# Altium schematic sheet Teclado_V2.SchDoc
size A2; SheetNumber: 1; SheetTotal: 1
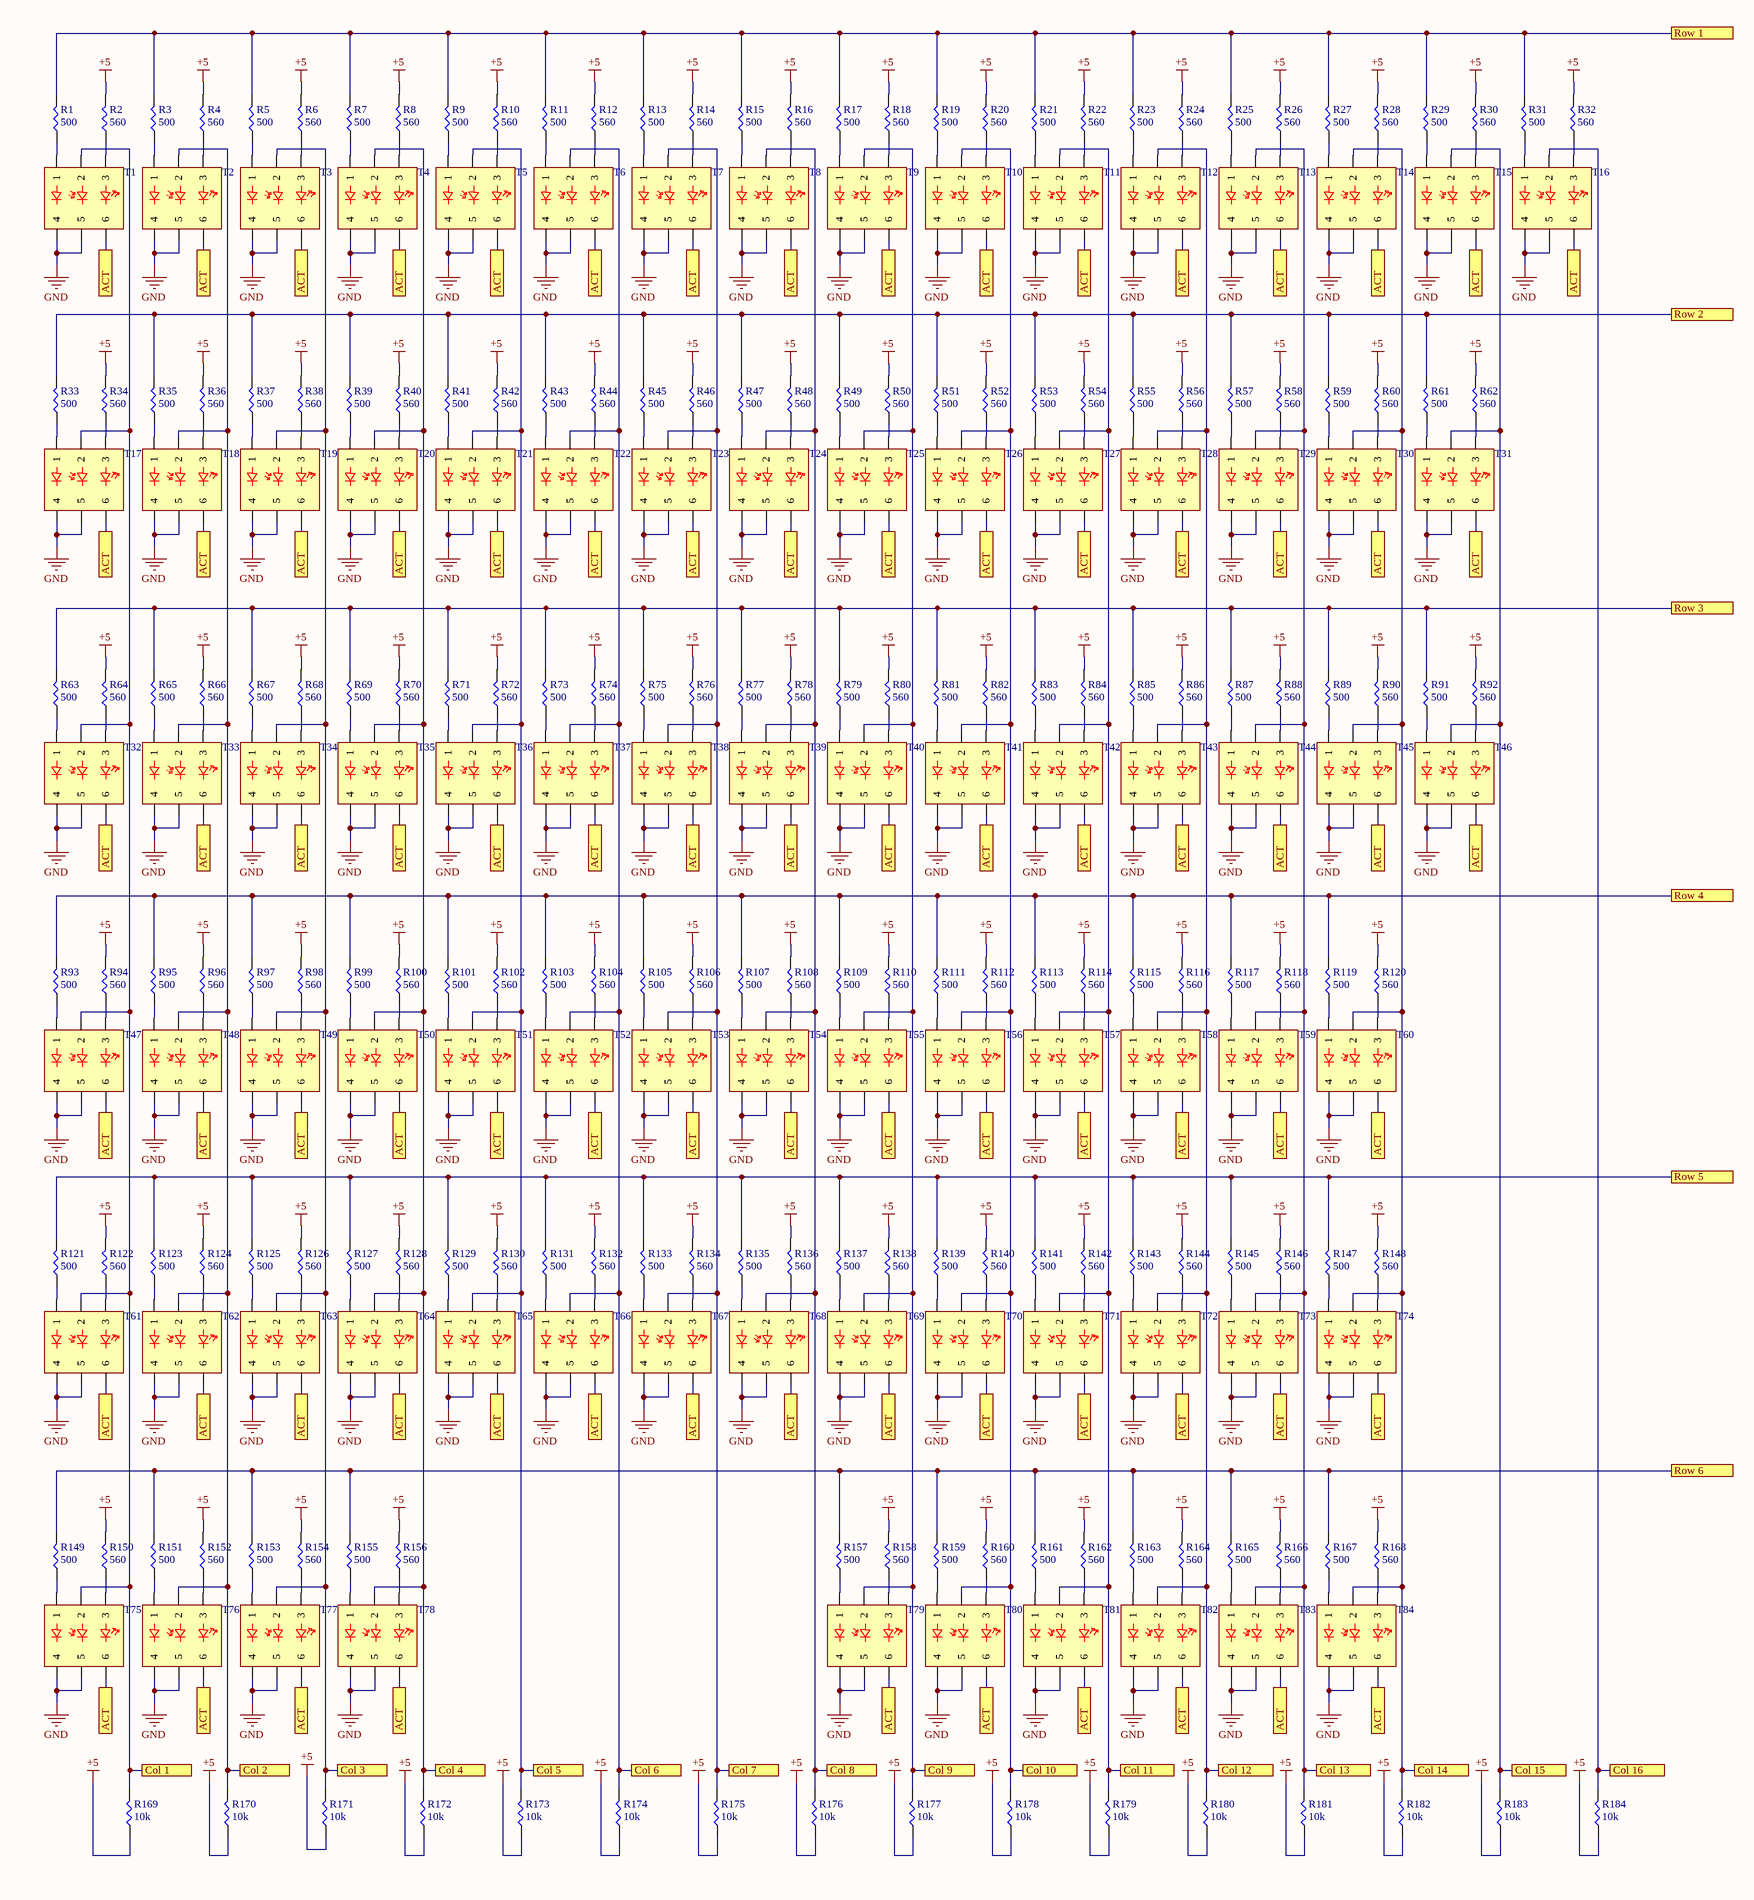
[diagram p0: Teclado_V2.SchDoc, left]
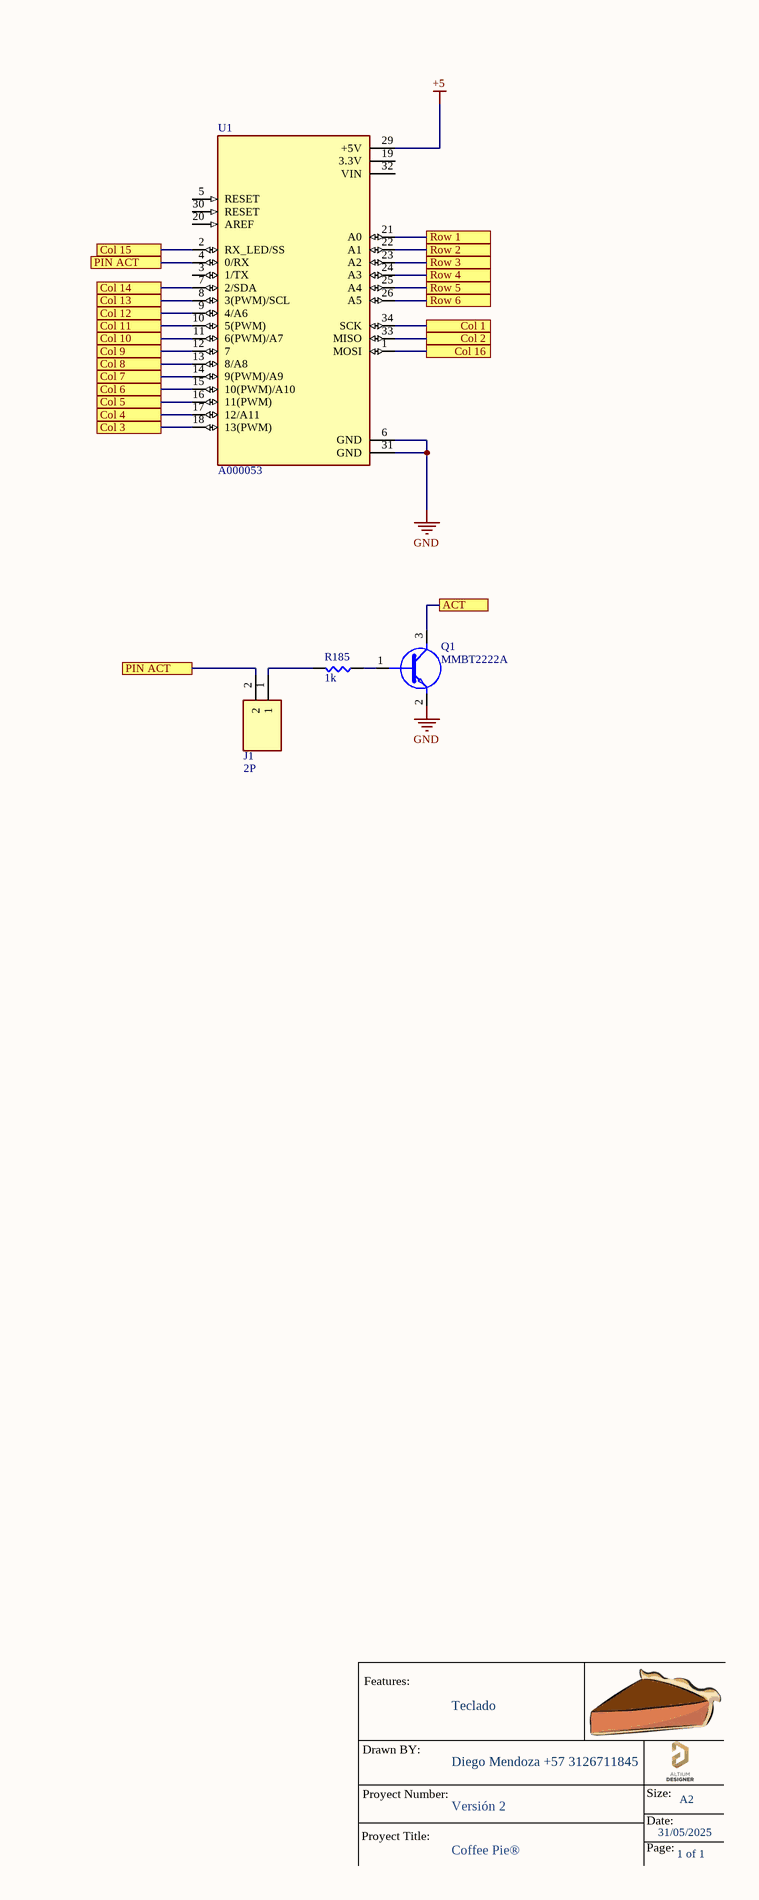
[diagram p1: Teclado_V2.SchDoc, right]

## Parts
J1  2P  [2P]
Q1  MMBT2222A  [MMBT2222A]
R1  500  [Res 0805]
R2  560  [Res 0805]
R3  500  [Res 0805]
R4  560  [Res 0805]
R5  500  [Res 0805]
R6  560  [Res 0805]
R7  500  [Res 0805]
R8  560  [Res 0805]
R9  500  [Res 0805]
R10  560  [Res 0805]
R11  500  [Res 0805]
R12  560  [Res 0805]
R13  500  [Res 0805]
R14  560  [Res 0805]
R15  500  [Res 0805]
R16  560  [Res 0805]
R17  500  [Res 0805]
R18  560  [Res 0805]
R19  500  [Res 0805]
R20  560  [Res 0805]
R21  500  [Res 0805]
R22  560  [Res 0805]
R23  500  [Res 0805]
R24  560  [Res 0805]
R25  500  [Res 0805]
R26  560  [Res 0805]
R27  500  [Res 0805]
R28  560  [Res 0805]
R29  500  [Res 0805]
R30  560  [Res 0805]
R31  500  [Res 0805]
R32  560  [Res 0805]
R33  500  [Res 0805]
R34  560  [Res 0805]
R35  500  [Res 0805]
R36  560  [Res 0805]
R37  500  [Res 0805]
R38  560  [Res 0805]
R39  500  [Res 0805]
R40  560  [Res 0805]
R41  500  [Res 0805]
R42  560  [Res 0805]
R43  500  [Res 0805]
R44  560  [Res 0805]
R45  500  [Res 0805]
R46  560  [Res 0805]
R47  500  [Res 0805]
R48  560  [Res 0805]
R49  500  [Res 0805]
R50  560  [Res 0805]
R51  500  [Res 0805]
R52  560  [Res 0805]
R53  500  [Res 0805]
R54  560  [Res 0805]
R55  500  [Res 0805]
R56  560  [Res 0805]
R57  500  [Res 0805]
R58  560  [Res 0805]
R59  500  [Res 0805]
R60  560  [Res 0805]
R61  500  [Res 0805]
R62  560  [Res 0805]
R63  500  [Res 0805]
R64  560  [Res 0805]
R65  500  [Res 0805]
R66  560  [Res 0805]
R67  500  [Res 0805]
R68  560  [Res 0805]
R69  500  [Res 0805]
R70  560  [Res 0805]
R71  500  [Res 0805]
R72  560  [Res 0805]
R73  500  [Res 0805]
R74  560  [Res 0805]
R75  500  [Res 0805]
R76  560  [Res 0805]
R77  500  [Res 0805]
R78  560  [Res 0805]
R79  500  [Res 0805]
R80  560  [Res 0805]
R81  500  [Res 0805]
R82  560  [Res 0805]
R83  500  [Res 0805]
R84  560  [Res 0805]
R85  500  [Res 0805]
R86  560  [Res 0805]
R87  500  [Res 0805]
R88  560  [Res 0805]
R89  500  [Res 0805]
R90  560  [Res 0805]
R91  500  [Res 0805]
R92  560  [Res 0805]
R93  500  [Res 0805]
R94  560  [Res 0805]
R95  500  [Res 0805]
R96  560  [Res 0805]
R97  500  [Res 0805]
R98  560  [Res 0805]
R99  500  [Res 0805]
R100  560  [Res 0805]
R101  500  [Res 0805]
R102  560  [Res 0805]
R103  500  [Res 0805]
R104  560  [Res 0805]
R105  500  [Res 0805]
R106  560  [Res 0805]
R107  500  [Res 0805]
R108  560  [Res 0805]
R109  500  [Res 0805]
R110  560  [Res 0805]
R111  500  [Res 0805]
R112  560  [Res 0805]
R113  500  [Res 0805]
R114  560  [Res 0805]
R115  500  [Res 0805]
R116  560  [Res 0805]
R117  500  [Res 0805]
R118  560  [Res 0805]
R119  500  [Res 0805]
R120  560  [Res 0805]
R121  500  [Res 0805]
R122  560  [Res 0805]
R123  500  [Res 0805]
R124  560  [Res 0805]
R125  500  [Res 0805]
R126  560  [Res 0805]
R127  500  [Res 0805]
R128  560  [Res 0805]
R129  500  [Res 0805]
R130  560  [Res 0805]
R131  500  [Res 0805]
R132  560  [Res 0805]
R133  500  [Res 0805]
R134  560  [Res 0805]
R135  500  [Res 0805]
R136  560  [Res 0805]
R137  500  [Res 0805]
R138  560  [Res 0805]
R139  500  [Res 0805]
R140  560  [Res 0805]
R141  500  [Res 0805]
R142  560  [Res 0805]
R143  500  [Res 0805]
R144  560  [Res 0805]
R145  500  [Res 0805]
R146  560  [Res 0805]
R147  500  [Res 0805]
R148  560  [Res 0805]
R149  500  [Res 0805]
R150  560  [Res 0805]
R151  500  [Res 0805]
R152  560  [Res 0805]
R153  500  [Res 0805]
R154  560  [Res 0805]
R155  500  [Res 0805]
R156  560  [Res 0805]
R157  500  [Res 0805]
R158  560  [Res 0805]
R159  500  [Res 0805]
R160  560  [Res 0805]
R161  500  [Res 0805]
R162  560  [Res 0805]
R163  500  [Res 0805]
R164  560  [Res 0805]
R165  500  [Res 0805]
R166  560  [Res 0805]
R167  500  [Res 0805]
R168  560  [Res 0805]
R169  10k  [Res 0805]
R170  10k  [Res 0805]
R171  10k  [Res 0805]
R172  10k  [Res 0805]
R173  10k  [Res 0805]
R174  10k  [Res 0805]
R175  10k  [Res 0805]
R176  10k  [Res 0805]
R177  10k  [Res 0805]
R178  10k  [Res 0805]
R179  10k  [Res 0805]
R180  10k  [Res 0805]
R181  10k  [Res 0805]
R182  10k  [Res 0805]
R183  10k  [Res 0805]
R184  10k  [Res 0805]
R185  1k  [Res 0805]
T1  Interruptor óptico Keychron de bajo perfil  [Interruptor óptico Keychron de bajo perfil]  (value not drawn)
T2  Interruptor óptico Keychron de bajo perfil  [Interruptor óptico Keychron de bajo perfil]  (value not drawn)
T3  Interruptor óptico Keychron de bajo perfil  [Interruptor óptico Keychron de bajo perfil]  (value not drawn)
T4  Interruptor óptico Keychron de bajo perfil  [Interruptor óptico Keychron de bajo perfil]  (value not drawn)
T5  Interruptor óptico Keychron de bajo perfil  [Interruptor óptico Keychron de bajo perfil]  (value not drawn)
T6  Interruptor óptico Keychron de bajo perfil  [Interruptor óptico Keychron de bajo perfil]  (value not drawn)
T7  Interruptor óptico Keychron de bajo perfil  [Interruptor óptico Keychron de bajo perfil]  (value not drawn)
T8  Interruptor óptico Keychron de bajo perfil  [Interruptor óptico Keychron de bajo perfil]  (value not drawn)
T9  Interruptor óptico Keychron de bajo perfil  [Interruptor óptico Keychron de bajo perfil]  (value not drawn)
T10  Interruptor óptico Keychron de bajo perfil  [Interruptor óptico Keychron de bajo perfil]  (value not drawn)
T11  Interruptor óptico Keychron de bajo perfil  [Interruptor óptico Keychron de bajo perfil]  (value not drawn)
T12  Interruptor óptico Keychron de bajo perfil  [Interruptor óptico Keychron de bajo perfil]  (value not drawn)
T13  Interruptor óptico Keychron de bajo perfil  [Interruptor óptico Keychron de bajo perfil]  (value not drawn)
T14  Interruptor óptico Keychron de bajo perfil  [Interruptor óptico Keychron de bajo perfil]  (value not drawn)
T15  Interruptor óptico Keychron de bajo perfil  [Interruptor óptico Keychron de bajo perfil]  (value not drawn)
T16  Interruptor óptico Keychron de bajo perfil  [Interruptor óptico Keychron de bajo perfil]  (value not drawn)
T17  Interruptor óptico Keychron de bajo perfil  [Interruptor óptico Keychron de bajo perfil]  (value not drawn)
T18  Interruptor óptico Keychron de bajo perfil  [Interruptor óptico Keychron de bajo perfil]  (value not drawn)
T19  Interruptor óptico Keychron de bajo perfil  [Interruptor óptico Keychron de bajo perfil]  (value not drawn)
T20  Interruptor óptico Keychron de bajo perfil  [Interruptor óptico Keychron de bajo perfil]  (value not drawn)
T21  Interruptor óptico Keychron de bajo perfil  [Interruptor óptico Keychron de bajo perfil]  (value not drawn)
T22  Interruptor óptico Keychron de bajo perfil  [Interruptor óptico Keychron de bajo perfil]  (value not drawn)
T23  Interruptor óptico Keychron de bajo perfil  [Interruptor óptico Keychron de bajo perfil]  (value not drawn)
T24  Interruptor óptico Keychron de bajo perfil  [Interruptor óptico Keychron de bajo perfil]  (value not drawn)
T25  Interruptor óptico Keychron de bajo perfil  [Interruptor óptico Keychron de bajo perfil]  (value not drawn)
T26  Interruptor óptico Keychron de bajo perfil  [Interruptor óptico Keychron de bajo perfil]  (value not drawn)
T27  Interruptor óptico Keychron de bajo perfil  [Interruptor óptico Keychron de bajo perfil]  (value not drawn)
T28  Interruptor óptico Keychron de bajo perfil  [Interruptor óptico Keychron de bajo perfil]  (value not drawn)
T29  Interruptor óptico Keychron de bajo perfil  [Interruptor óptico Keychron de bajo perfil]  (value not drawn)
T30  Interruptor óptico Keychron de bajo perfil  [Interruptor óptico Keychron de bajo perfil]  (value not drawn)
T31  Interruptor óptico Keychron de bajo perfil  [Interruptor óptico Keychron de bajo perfil]  (value not drawn)
T32  Interruptor óptico Keychron de bajo perfil  [Interruptor óptico Keychron de bajo perfil]  (value not drawn)
T33  Interruptor óptico Keychron de bajo perfil  [Interruptor óptico Keychron de bajo perfil]  (value not drawn)
T34  Interruptor óptico Keychron de bajo perfil  [Interruptor óptico Keychron de bajo perfil]  (value not drawn)
T35  Interruptor óptico Keychron de bajo perfil  [Interruptor óptico Keychron de bajo perfil]  (value not drawn)
T36  Interruptor óptico Keychron de bajo perfil  [Interruptor óptico Keychron de bajo perfil]  (value not drawn)
T37  Interruptor óptico Keychron de bajo perfil  [Interruptor óptico Keychron de bajo perfil]  (value not drawn)
T38  Interruptor óptico Keychron de bajo perfil  [Interruptor óptico Keychron de bajo perfil]  (value not drawn)
T39  Interruptor óptico Keychron de bajo perfil  [Interruptor óptico Keychron de bajo perfil]  (value not drawn)
T40  Interruptor óptico Keychron de bajo perfil  [Interruptor óptico Keychron de bajo perfil]  (value not drawn)
T41  Interruptor óptico Keychron de bajo perfil  [Interruptor óptico Keychron de bajo perfil]  (value not drawn)
T42  Interruptor óptico Keychron de bajo perfil  [Interruptor óptico Keychron de bajo perfil]  (value not drawn)
T43  Interruptor óptico Keychron de bajo perfil  [Interruptor óptico Keychron de bajo perfil]  (value not drawn)
T44  Interruptor óptico Keychron de bajo perfil  [Interruptor óptico Keychron de bajo perfil]  (value not drawn)
T45  Interruptor óptico Keychron de bajo perfil  [Interruptor óptico Keychron de bajo perfil]  (value not drawn)
T46  Interruptor óptico Keychron de bajo perfil  [Interruptor óptico Keychron de bajo perfil]  (value not drawn)
T47  Interruptor óptico Keychron de bajo perfil  [Interruptor óptico Keychron de bajo perfil]  (value not drawn)
T48  Interruptor óptico Keychron de bajo perfil  [Interruptor óptico Keychron de bajo perfil]  (value not drawn)
T49  Interruptor óptico Keychron de bajo perfil  [Interruptor óptico Keychron de bajo perfil]  (value not drawn)
T50  Interruptor óptico Keychron de bajo perfil  [Interruptor óptico Keychron de bajo perfil]  (value not drawn)
T51  Interruptor óptico Keychron de bajo perfil  [Interruptor óptico Keychron de bajo perfil]  (value not drawn)
T52  Interruptor óptico Keychron de bajo perfil  [Interruptor óptico Keychron de bajo perfil]  (value not drawn)
T53  Interruptor óptico Keychron de bajo perfil  [Interruptor óptico Keychron de bajo perfil]  (value not drawn)
T54  Interruptor óptico Keychron de bajo perfil  [Interruptor óptico Keychron de bajo perfil]  (value not drawn)
T55  Interruptor óptico Keychron de bajo perfil  [Interruptor óptico Keychron de bajo perfil]  (value not drawn)
T56  Interruptor óptico Keychron de bajo perfil  [Interruptor óptico Keychron de bajo perfil]  (value not drawn)
T57  Interruptor óptico Keychron de bajo perfil  [Interruptor óptico Keychron de bajo perfil]  (value not drawn)
T58  Interruptor óptico Keychron de bajo perfil  [Interruptor óptico Keychron de bajo perfil]  (value not drawn)
T59  Interruptor óptico Keychron de bajo perfil  [Interruptor óptico Keychron de bajo perfil]  (value not drawn)
T60  Interruptor óptico Keychron de bajo perfil  [Interruptor óptico Keychron de bajo perfil]  (value not drawn)
T61  Interruptor óptico Keychron de bajo perfil  [Interruptor óptico Keychron de bajo perfil]  (value not drawn)
T62  Interruptor óptico Keychron de bajo perfil  [Interruptor óptico Keychron de bajo perfil]  (value not drawn)
T63  Interruptor óptico Keychron de bajo perfil  [Interruptor óptico Keychron de bajo perfil]  (value not drawn)
T64  Interruptor óptico Keychron de bajo perfil  [Interruptor óptico Keychron de bajo perfil]  (value not drawn)
T65  Interruptor óptico Keychron de bajo perfil  [Interruptor óptico Keychron de bajo perfil]  (value not drawn)
T66  Interruptor óptico Keychron de bajo perfil  [Interruptor óptico Keychron de bajo perfil]  (value not drawn)
T67  Interruptor óptico Keychron de bajo perfil  [Interruptor óptico Keychron de bajo perfil]  (value not drawn)
T68  Interruptor óptico Keychron de bajo perfil  [Interruptor óptico Keychron de bajo perfil]  (value not drawn)
T69  Interruptor óptico Keychron de bajo perfil  [Interruptor óptico Keychron de bajo perfil]  (value not drawn)
T70  Interruptor óptico Keychron de bajo perfil  [Interruptor óptico Keychron de bajo perfil]  (value not drawn)
T71  Interruptor óptico Keychron de bajo perfil  [Interruptor óptico Keychron de bajo perfil]  (value not drawn)
T72  Interruptor óptico Keychron de bajo perfil  [Interruptor óptico Keychron de bajo perfil]  (value not drawn)
T73  Interruptor óptico Keychron de bajo perfil  [Interruptor óptico Keychron de bajo perfil]  (value not drawn)
T74  Interruptor óptico Keychron de bajo perfil  [Interruptor óptico Keychron de bajo perfil]  (value not drawn)
T75  Interruptor óptico Keychron de bajo perfil  [Interruptor óptico Keychron de bajo perfil]  (value not drawn)
T76  Interruptor óptico Keychron de bajo perfil  [Interruptor óptico Keychron de bajo perfil]  (value not drawn)
T77  Interruptor óptico Keychron de bajo perfil  [Interruptor óptico Keychron de bajo perfil]  (value not drawn)
T78  Interruptor óptico Keychron de bajo perfil  [Interruptor óptico Keychron de bajo perfil]  (value not drawn)
T79  Interruptor óptico Keychron de bajo perfil  [Interruptor óptico Keychron de bajo perfil]  (value not drawn)
T80  Interruptor óptico Keychron de bajo perfil  [Interruptor óptico Keychron de bajo perfil]  (value not drawn)
T81  Interruptor óptico Keychron de bajo perfil  [Interruptor óptico Keychron de bajo perfil]  (value not drawn)
T82  Interruptor óptico Keychron de bajo perfil  [Interruptor óptico Keychron de bajo perfil]  (value not drawn)
T83  Interruptor óptico Keychron de bajo perfil  [Interruptor óptico Keychron de bajo perfil]  (value not drawn)
T84  Interruptor óptico Keychron de bajo perfil  [Interruptor óptico Keychron de bajo perfil]  (value not drawn)
U1  A000053  [ARDUINO_A000053]

## Ports
ACT (see Teclado_V2[1A], Teclado_V2[1B], Teclado_V2[1C], Teclado_V2[1D], Teclado_V2[2A], Teclado_V2[2B], Teclado_V2[2C], Teclado_V2[2D], Teclado_V2[3A], Teclado_V2[3B], Teclado_V2[3C], Teclado_V2[3D], Teclado_V2[4A], Teclado_V2[4B], Teclado_V2[4C], Teclado_V2[4D], Teclado_V2[5A], Teclado_V2[5B], Teclado_V2[5C], Teclado_V2[5D]), ACT (see Teclado_V2[1A], Teclado_V2[1B], Teclado_V2[1C], Teclado_V2[1D], Teclado_V2[2A], Teclado_V2[2B], Teclado_V2[2C], Teclado_V2[2D], Teclado_V2[3A], Teclado_V2[3B], Teclado_V2[3C], Teclado_V2[3D], Teclado_V2[4A], Teclado_V2[4B], Teclado_V2[4C], Teclado_V2[4D], Teclado_V2[5A], Teclado_V2[5B], Teclado_V2[5C], Teclado_V2[5D], Teclado_V2[8B]), ACT (see Teclado_V2[1A], Teclado_V2[1B], Teclado_V2[1C], Teclado_V2[1D], Teclado_V2[2A], Teclado_V2[2B], Teclado_V2[2C], Teclado_V2[2D], Teclado_V2[3A], Teclado_V2[3B], Teclado_V2[3C], Teclado_V2[3D], Teclado_V2[4A], Teclado_V2[4B], Teclado_V2[4C], Teclado_V2[4D], Teclado_V2[5A], Teclado_V2[5B], Teclado_V2[5D], Teclado_V2[8B]), Col 1 (see Teclado_V2[1D]), Col 1 (see Teclado_V2[8A]), Col 2 (see Teclado_V2[1D]), Col 2 (see Teclado_V2[8A]), Col 3 (see Teclado_V2[2D]), Col 3 (see Teclado_V2[7B]), Col 4 (see Teclado_V2[2D]), Col 4 (see Teclado_V2[7B]), Col 5 (see Teclado_V2[2D]), Col 5 (see Teclado_V2[7A]), Col 6 (see Teclado_V2[3D]), Col 6 (see Teclado_V2[7A]), Col 7 (see Teclado_V2[3D]), Col 7 (see Teclado_V2[7A]), Col 8 (see Teclado_V2[3D]), Col 8 (see Teclado_V2[7A]), Col 9 (see Teclado_V2[3D]), Col 9 (see Teclado_V2[7A]), Col 10 (see Teclado_V2[4D]), Col 10 (see Teclado_V2[7A]), Col 11 (see Teclado_V2[4D]), Col 11 (see Teclado_V2[7A]), Col 12 (see Teclado_V2[4D]), Col 12 (see Teclado_V2[7A]), Col 13 (see Teclado_V2[5D]), Col 13 (see Teclado_V2[7A]), Col 14 (see Teclado_V2[5D]), Col 14 (see Teclado_V2[7A]), Col 15 (see Teclado_V2[5D]), Col 15 (see Teclado_V2[7A]), Col 16 (see Teclado_V2[5D]), Col 16 (see Teclado_V2[8A]), PIN ACT (see Teclado_V2[7A]), PIN ACT (see Teclado_V2[7B]), Row 1 (see Teclado_V2[6A]), Row 1 (see Teclado_V2[8A]), Row 2 (see Teclado_V2[6A]), Row 2 (see Teclado_V2[8A]), Row 3 (see Teclado_V2[6B]), Row 3 (see Teclado_V2[8A]), Row 4 (see Teclado_V2[6B]), Row 4 (see Teclado_V2[8A]), Row 5 (see Teclado_V2[6C]), Row 5 (see Teclado_V2[8A]), Row 6 (see Teclado_V2[6D]), Row 6 (see Teclado_V2[8A])

## Nets
+5: R2.2 R4.2 R6.2 R8.2 R10.2 R12.2 R14.2 R16.2 R18.2 R20.2 R22.2 R24.2 R26.2 R28.2 R30.2 R32.2 R34.2 R36.2 R38.2 R40.2 R42.2 R44.2 R46.2 R48.2 R50.2 R52.2 R54.2 R56.2 R58.2 R60.2 R62.2 R64.2 R66.2 R68.2 R70.2 R72.2 R74.2 R76.2 R78.2 R80.2 R82.2 R84.2 R86.2 R88.2 R90.2 R92.2 R94.2 R96.2 R98.2 R100.2 R102.2 R104.2 R106.2 R108.2 R110.2 R112.2 R114.2 R116.2 R118.2 R120.2 R122.2 R124.2 R126.2 R128.2 R130.2 R132.2 R134.2 R136.2 R138.2 R140.2 R142.2 R144.2 R146.2 R148.2 R150.2 R152.2 R154.2 R156.2 R158.2 R160.2 R162.2 R164.2 R166.2 R168.2 R169.1 R170.1 R171.1 R172.1 R173.1 R174.1 R175.1 R176.1 R177.1 R178.1 R179.1 R180.1 R181.1 R182.1 R183.1 R184.1 U1.29(+5V)
GND: Q1.2(E) T1.4 T1.5 T2.4 T2.5 T3.4 T3.5 T4.4 T4.5 T5.4 T5.5 T6.4 T6.5 T7.4 T7.5 T8.4 T8.5 T9.4 T9.5 T10.4 T10.5 T11.4 T11.5 T12.4 T12.5 T13.4 T13.5 T14.4 T14.5 T15.4 T15.5 T16.4 T16.5 T17.4 T17.5 T18.4 T18.5 T19.4 T19.5 T20.4 T20.5 T21.4 T21.5 T22.4 T22.5 T23.4 T23.5 T24.4 T24.5 T25.4 T25.5 T26.4 T26.5 T27.4 T27.5 T28.4 T28.5 T29.4 T29.5 T30.4 T30.5 T31.4 T31.5 T32.4 T32.5 T33.4 T33.5 T34.4 T34.5 T35.4 T35.5 T36.4 T36.5 T37.4 T37.5 T38.4 T38.5 T39.4 T39.5 T40.4 T40.5 T41.4 T41.5 T42.4 T42.5 T43.4 T43.5 T44.4 T44.5 T45.4 T45.5 T46.4 T46.5 T47.4 T47.5 T48.4 T48.5 T49.4 T49.5 T50.4 T50.5 T51.4 T51.5 T52.4 T52.5 T53.4 T53.5 T54.4 T54.5 T55.4 T55.5 T56.4 T56.5 T57.4 T57.5 T58.4 T58.5 T59.4 T59.5 T60.4 T60.5 T61.4 T61.5 T62.4 T62.5 T63.4 T63.5 T64.4 T64.5 T65.4 T65.5 T66.4 T66.5 T67.4 T67.5 T68.4 T68.5 T69.4 T69.5 T70.4 T70.5 T71.4 T71.5 T72.4 T72.5 T73.4 T73.5 T74.4 T74.5 T75.4 T75.5 T76.4 T76.5 T77.4 T77.5 T78.4 T78.5 T79.4 T79.5 T80.4 T80.5 T81.4 T81.5 T82.4 T82.5 T83.4 T83.5 T84.4 T84.5 U1.6(GND) U1.31(GND)
ACT: Q1.3(C) T1.6 T2.6 T3.6 T4.6 T5.6 T6.6 T7.6 T8.6 T9.6 T10.6 T11.6 T12.6 T13.6 T14.6 T15.6 T16.6 T17.6 T18.6 T19.6 T20.6 T21.6 T22.6 T23.6 T24.6 T25.6 T26.6 T27.6 T28.6 T29.6 T30.6 T31.6 T32.6 T33.6 T34.6 T35.6 T36.6 T37.6 T38.6 T39.6 T40.6 T41.6 T42.6 T43.6 T44.6 T45.6 T46.6 T47.6 T48.6 T49.6 T50.6 T51.6 T52.6 T53.6 T54.6 T55.6 T56.6 T57.6 T58.6 T59.6 T60.6 T61.6 T62.6 T63.6 T64.6 T65.6 T66.6 T67.6 T68.6 T69.6 T70.6 T71.6 T72.6 T73.6 T74.6 T75.6 T76.6 T77.6 T78.6 T79.6 T80.6 T81.6 T82.6 T83.6 T84.6 ; port ACT
Col 1: R169.2 T1.2 T17.2 T32.2 T47.2 T61.2 T75.2 U1.34(SCK) ; port Col 1
Col 2: R170.2 T2.2 T18.2 T33.2 T48.2 T62.2 T76.2 U1.33(MISO) ; port Col 2
Col 3: R171.2 T3.2 T19.2 T34.2 T49.2 T63.2 T77.2 U1.18(13(PWM)) ; port Col 3
Col 4: R172.2 T4.2 T20.2 T35.2 T50.2 T64.2 T78.2 U1.17(12/A11) ; port Col 4
Col 5: R173.2 T5.2 T21.2 T36.2 T51.2 T65.2 U1.16(11(PWM)) ; port Col 5
Col 6: R174.2 T6.2 T22.2 T37.2 T52.2 T66.2 U1.15(10(PWM)/A10) ; port Col 6
Col 7: R175.2 T7.2 T23.2 T38.2 T53.2 T67.2 U1.14(9(PWM)/A9) ; port Col 7
Col 8: R176.2 T8.2 T24.2 T39.2 T54.2 T68.2 U1.13(8/A8) ; port Col 8
Col 9: R177.2 T9.2 T25.2 T40.2 T55.2 T69.2 T79.2 U1.12(7) ; port Col 9
Col 10: R178.2 T10.2 T26.2 T41.2 T56.2 T70.2 T80.2 U1.11(6(PWM)/A7) ; port Col 10
Col 11: R179.2 T11.2 T27.2 T42.2 T57.2 T71.2 T81.2 U1.10(5(PWM)) ; port Col 11
Col 12: R180.2 T12.2 T28.2 T43.2 T58.2 T72.2 T82.2 U1.9(4/A6) ; port Col 12
Col 13: R181.2 T13.2 T29.2 T44.2 T59.2 T73.2 T83.2 U1.8(3(PWM)/SCL) ; port Col 13
Col 14: R182.2 T14.2 T30.2 T45.2 T60.2 T74.2 T84.2 U1.7(2/SDA) ; port Col 14
Col 15: R183.2 T15.2 T31.2 T46.2 U1.2(RX_LED/SS) ; port Col 15
Col 16: R184.2 T16.2 U1.1(MOSI) ; port Col 16
PIN ACT: J1.2 U1.4(0/RX) ; port PIN ACT
Row 1: R1.2 R3.2 R5.2 R7.2 R9.2 R11.2 R13.2 R15.2 R17.2 R19.2 R21.2 R23.2 R25.2 R27.2 R29.2 R31.2 U1.21(A0) ; port Row 1
Row 2: R33.2 R35.2 R37.2 R39.2 R41.2 R43.2 R45.2 R47.2 R49.2 R51.2 R53.2 R55.2 R57.2 R59.2 R61.2 U1.22(A1) ; port Row 2
Row 3: R63.2 R65.2 R67.2 R69.2 R71.2 R73.2 R75.2 R77.2 R79.2 R81.2 R83.2 R85.2 R87.2 R89.2 R91.2 U1.23(A2) ; port Row 3
Row 4: R93.2 R95.2 R97.2 R99.2 R101.2 R103.2 R105.2 R107.2 R109.2 R111.2 R113.2 R115.2 R117.2 R119.2 U1.24(A3) ; port Row 4
Row 5: R121.2 R123.2 R125.2 R127.2 R129.2 R131.2 R133.2 R135.2 R137.2 R139.2 R141.2 R143.2 R145.2 R147.2 U1.25(A4) ; port Row 5
Row 6: R149.2 R151.2 R153.2 R155.2 R157.2 R159.2 R161.2 R163.2 R165.2 R167.2 U1.26(A5) ; port Row 6
NetJ1_1: J1.1 R185.2
NetQ1_1: Q1.1(B) R185.1
NetR1_1: R1.1 T1.1
NetR2_1: R2.1 T1.3
NetR3_1: R3.1 T2.1
NetR4_1: R4.1 T2.3
NetR5_1: R5.1 T3.1
NetR6_1: R6.1 T3.3
NetR7_1: R7.1 T4.1
NetR8_1: R8.1 T4.3
NetR9_1: R9.1 T5.1
NetR10_1: R10.1 T5.3
NetR11_1: R11.1 T6.1
NetR12_1: R12.1 T6.3
NetR13_1: R13.1 T7.1
NetR14_1: R14.1 T7.3
NetR15_1: R15.1 T8.1
NetR16_1: R16.1 T8.3
NetR17_1: R17.1 T9.1
NetR18_1: R18.1 T9.3
NetR19_1: R19.1 T10.1
NetR20_1: R20.1 T10.3
NetR21_1: R21.1 T11.1
NetR22_1: R22.1 T11.3
NetR23_1: R23.1 T12.1
NetR24_1: R24.1 T12.3
NetR25_1: R25.1 T13.1
NetR26_1: R26.1 T13.3
NetR27_1: R27.1 T14.1
NetR28_1: R28.1 T14.3
NetR29_1: R29.1 T15.1
NetR30_1: R30.1 T15.3
NetR31_1: R31.1 T16.1
NetR32_1: R32.1 T16.3
NetR33_1: R33.1 T17.1
NetR34_1: R34.1 T17.3
NetR35_1: R35.1 T18.1
NetR36_1: R36.1 T18.3
NetR37_1: R37.1 T19.1
NetR38_1: R38.1 T19.3
NetR39_1: R39.1 T20.1
NetR40_1: R40.1 T20.3
NetR41_1: R41.1 T21.1
NetR42_1: R42.1 T21.3
NetR43_1: R43.1 T22.1
NetR44_1: R44.1 T22.3
NetR45_1: R45.1 T23.1
NetR46_1: R46.1 T23.3
NetR47_1: R47.1 T24.1
NetR48_1: R48.1 T24.3
NetR49_1: R49.1 T25.1
NetR50_1: R50.1 T25.3
NetR51_1: R51.1 T26.1
NetR52_1: R52.1 T26.3
NetR53_1: R53.1 T27.1
NetR54_1: R54.1 T27.3
NetR55_1: R55.1 T28.1
NetR56_1: R56.1 T28.3
NetR57_1: R57.1 T29.1
NetR58_1: R58.1 T29.3
NetR59_1: R59.1 T30.1
NetR60_1: R60.1 T30.3
NetR61_1: R61.1 T31.1
NetR62_1: R62.1 T31.3
NetR63_1: R63.1 T32.1
NetR64_1: R64.1 T32.3
NetR65_1: R65.1 T33.1
NetR66_1: R66.1 T33.3
NetR67_1: R67.1 T34.1
NetR68_1: R68.1 T34.3
NetR69_1: R69.1 T35.1
NetR70_1: R70.1 T35.3
NetR71_1: R71.1 T36.1
NetR72_1: R72.1 T36.3
NetR73_1: R73.1 T37.1
NetR74_1: R74.1 T37.3
NetR75_1: R75.1 T38.1
NetR76_1: R76.1 T38.3
NetR77_1: R77.1 T39.1
NetR78_1: R78.1 T39.3
NetR79_1: R79.1 T40.1
NetR80_1: R80.1 T40.3
NetR81_1: R81.1 T41.1
NetR82_1: R82.1 T41.3
NetR83_1: R83.1 T42.1
NetR84_1: R84.1 T42.3
NetR85_1: R85.1 T43.1
NetR86_1: R86.1 T43.3
NetR87_1: R87.1 T44.1
NetR88_1: R88.1 T44.3
NetR89_1: R89.1 T45.1
NetR90_1: R90.1 T45.3
NetR91_1: R91.1 T46.1
NetR92_1: R92.1 T46.3
NetR93_1: R93.1 T47.1
NetR94_1: R94.1 T47.3
NetR95_1: R95.1 T48.1
NetR96_1: R96.1 T48.3
NetR97_1: R97.1 T49.1
NetR98_1: R98.1 T49.3
NetR99_1: R99.1 T50.1
NetR100_1: R100.1 T50.3
NetR101_1: R101.1 T51.1
NetR102_1: R102.1 T51.3
NetR103_1: R103.1 T52.1
NetR104_1: R104.1 T52.3
NetR105_1: R105.1 T53.1
NetR106_1: R106.1 T53.3
NetR107_1: R107.1 T54.1
NetR108_1: R108.1 T54.3
NetR109_1: R109.1 T55.1
NetR110_1: R110.1 T55.3
NetR111_1: R111.1 T56.1
NetR112_1: R112.1 T56.3
NetR113_1: R113.1 T57.1
NetR114_1: R114.1 T57.3
NetR115_1: R115.1 T58.1
NetR116_1: R116.1 T58.3
NetR117_1: R117.1 T59.1
NetR118_1: R118.1 T59.3
NetR119_1: R119.1 T60.1
NetR120_1: R120.1 T60.3
NetR121_1: R121.1 T61.1
NetR122_1: R122.1 T61.3
NetR123_1: R123.1 T62.1
NetR124_1: R124.1 T62.3
NetR125_1: R125.1 T63.1
NetR126_1: R126.1 T63.3
NetR127_1: R127.1 T64.1
NetR128_1: R128.1 T64.3
NetR129_1: R129.1 T65.1
NetR130_1: R130.1 T65.3
NetR131_1: R131.1 T66.1
NetR132_1: R132.1 T66.3
NetR133_1: R133.1 T67.1
NetR134_1: R134.1 T67.3
NetR135_1: R135.1 T68.1
NetR136_1: R136.1 T68.3
NetR137_1: R137.1 T69.1
NetR138_1: R138.1 T69.3
NetR139_1: R139.1 T70.1
NetR140_1: R140.1 T70.3
NetR141_1: R141.1 T71.1
NetR142_1: R142.1 T71.3
NetR143_1: R143.1 T72.1
NetR144_1: R144.1 T72.3
NetR145_1: R145.1 T73.1
NetR146_1: R146.1 T73.3
NetR147_1: R147.1 T74.1
NetR148_1: R148.1 T74.3
NetR149_1: R149.1 T75.1
NetR150_1: R150.1 T75.3
NetR151_1: R151.1 T76.1
NetR152_1: R152.1 T76.3
NetR153_1: R153.1 T77.1
NetR154_1: R154.1 T77.3
NetR155_1: R155.1 T78.1
NetR156_1: R156.1 T78.3
NetR157_1: R157.1 T79.1
NetR158_1: R158.1 T79.3
NetR159_1: R159.1 T80.1
NetR160_1: R160.1 T80.3
NetR161_1: R161.1 T81.1
NetR162_1: R162.1 T81.3
NetR163_1: R163.1 T82.1
NetR164_1: R164.1 T82.3
NetR165_1: R165.1 T83.1
NetR166_1: R166.1 T83.3
NetR167_1: R167.1 T84.1
NetR168_1: R168.1 T84.3

Not connected (* = marked no-connect by the designer): U1 3(1/TX) 5(RESET) 19(3.3V) 20(AREF) 30(RESET) 32(VIN)

## Notes on the sheet
- Features:
- Teclado
- Proyect Number:
- Drawn BY:
- Diego Mendoza +57 3126711845
- Size:
- A2
- Proyect Title:
- Versión 2
- Coffee Pie®
- Date:
- Page:
- 31/05/2025
- 1 of 1

## Library data of the parts
R1-R185 = Res 0805
U1 = A000053: Microcontroller board based on the ATmega32u4; MF: Arduino; MP: Arduino Micro; SnapEDA_Link: https://www.snapeda.com/parts/Arduino%20Micro/Arduino/view-part/?ref=snap; Package: Non-Standard Arduino; Value: *; Check_prices: https://www.snapeda.com/parts/Arduino%20Micro/Arduino/view-part/?ref=eda